# Altium schematic sheet RV1126_DRAM_SHEET.SchDoc
size A4; SheetNumber: 10; SheetTotal: 25
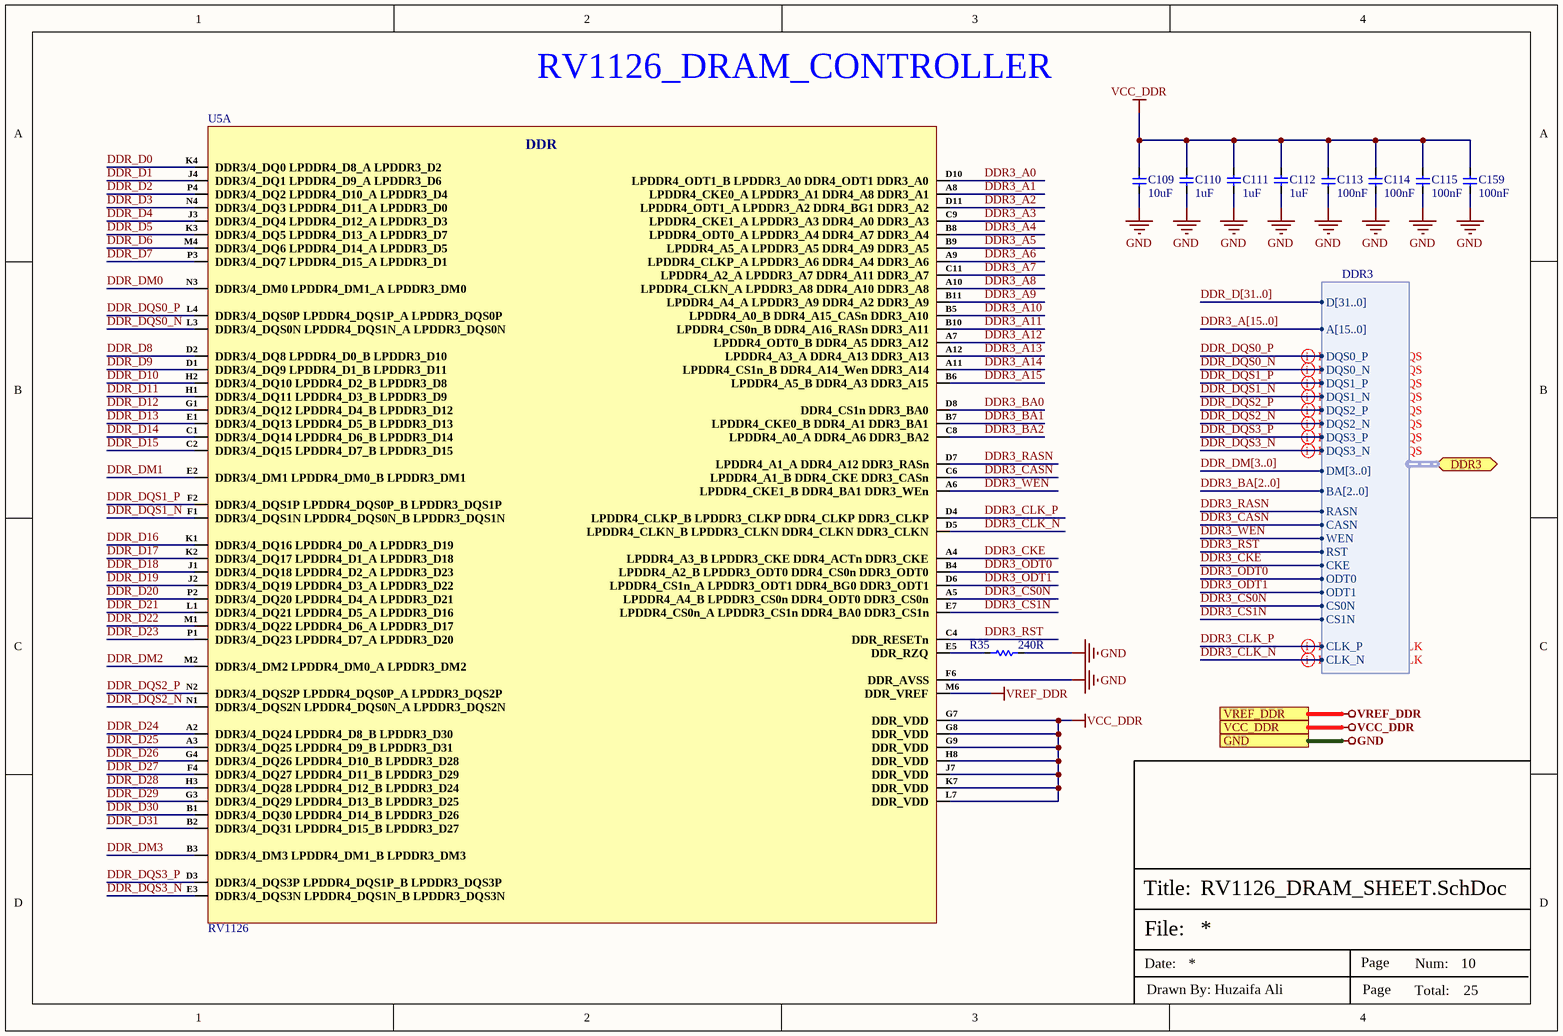
[diagram p0: RV1126_DRAM_SHEET.SchDoc]

## Parts
C109  10uF  [Cap-0603]
C110  1uF  [Cap-0402]
C111  1uF  [Cap-0402]
C112  1uF  [Cap-0402]
C113  100nF  [CAP-0201]
C114  100nF  [CAP-0201]
C115  100nF  [CAP-0201]
C159  100nF  [CAP-0201]
R35  240R  [Res-0201]
U5  RV1126  [FCCSP-409(14x14)]  (part A of 15)

## Ports
DDR3 (bidir, harness DDR3, see DDR3_SDRAM_INTERFACE[4C]), GND (see DDR3_SDRAM_INTERFACE[4D], DIGITAL_MEMS_MIC_INTERFACE[3D], eMMC_INTERFACE[3D], ETHERNET_SWITCH_INTERFACE[5C], IR-CUT_LIGHT SENSOR_SHEET[3D], MIPI TO HDMI_MODULE_INTERFACE[3D], MIPI-CSI_RXX_INTERFACE[4C], PoE PD INTERFACE[3D], PoE_PSE_CONTROLLER[5D], POWER_LDO_SHEET[3D], POWER_PMIC_RK809_CODEC[3D], POWER_PMIC_RK809_DC DC[3D], POWER_PMIC_RK809_LDO[4C], POWER_PMIC_RK809_MANAGEMENT[3D], RV1126_AUDIO_SHEET[3D], RV1126_eMMC_SPI-FLASH_SHEET[3D], RV1126_ETHERNET_SHEET[3D], RV1126_OSC-PLL-PMUIO[3C], RV1126_POWER_SHEET[1D], RV1126_SARADC_SHEET[3C], SPI_FLASH_INTERFACE[3D], SYNCHRONOUS _BUCK_CONTROLLER[3D], USB2.0_DEBUG_UART[3D], WIFI_AP6256_SHEET[4D]), VCC_DDR (see DDR3_SDRAM_INTERFACE[4D], POWER_PMIC_RK809_DC DC[3D]), VREF_DDR (see DDR3_SDRAM_INTERFACE[4D])

## Harnesses
DDR3: D[31..0], A[15..0], DQS0_N, DQS0_P, DQS1_N, DQS1_P, BA[2..0], CASN, RST, CKE, CS0N, CLK_P, CLK_N, DQS2_N, DQS2_P, DQS3_N, DQS3_P, CS1N, ODT0, ODT1, WEN, RASN, DM[3..0]

## Nets
GND: C109.1 C110.2 C111.2 C112.2 C113.1 C114.1 C115.1 C159.1 R35.2 U5.F6(DDR_AVSS) ; port GND
VCC_DDR: C109.2 C110.1 C111.1 C112.1 C113.2 C114.2 C115.2 C159.2 U5.G7(DDR_VDD) U5.G8(DDR_VDD) U5.G9(DDR_VDD) U5.H8(DDR_VDD) U5.J7(DDR_VDD) U5.K7(DDR_VDD) U5.L7(DDR_VDD) ; port VCC_DDR
VREF_DDR: U5.M6(DDR_VREF) ; port VREF_DDR
DDR3_A0: U5.D10(LPDDR4_ODT1_B_LPDDR3_A0_DDR4_ODT1_DDR3_A0)
DDR3_A1: U5.A8(LPDDR4_CKE0_A_LPDDR3_A1_DDR4_A8_DDR3_A1)
DDR3_A2: U5.D11(LPDDR4_ODT1_A_LPDDR3_A2_DDR4_BG1_DDR3_A2)
DDR3_A3: U5.C9(LPDDR4_CKE1_A_LPDDR3_A3_DDR4_A0_DDR3_A3)
DDR3_A4: U5.B8(LPDDR4_ODT0_A_LPDDR3_A4_DDR4_A7_DDR3_A4)
DDR3_A5: U5.B9(LPDDR4_A5_A_LPDDR3_A5_DDR4_A9_DDR3_A5)
DDR3_A6: U5.A9(LPDDR4_CLKP_A_LPDDR3_A6_DDR4_A4_DDR3_A6)
DDR3_A7: U5.C11(LPDDR4_A2_A_LPDDR3_A7_DDR4_A11_DDR3_A7)
DDR3_A8: U5.A10(LPDDR4_CLKN_A_LPDDR3_A8_DDR4_A10_DDR3_A8)
DDR3_A9: U5.B11(LPDDR4_A4_A_LPDDR3_A9_DDR4_A2_DDR3_A9)
DDR3_A10: U5.B5(LPDDR4_A0_B_DDR4_A15_CASn_DDR3_A10)
DDR3_A11: U5.B10(LPDDR4_CS0n_B_DDR4_A16_RASn_DDR3_A11)
DDR3_A12: U5.A7(LPDDR4_ODT0_B_DDR4_A5_DDR3_A12)
DDR3_A13: U5.A12(LPDDR4_A3_A_DDR4_A13_DDR3_A13)
DDR3_A14: U5.A11(LPDDR4_CS1n_B_DDR4_A14_Wen_DDR3_A14)
DDR3_A15: U5.B6(LPDDR4_A5_B_DDR4_A3_DDR3_A15)
DDR3_BA0: U5.D8(DDR4_CS1n_DDR3_BA0)
DDR3_BA1: U5.B7(LPDDR4_CKE0_B_DDR4_A1_DDR3_BA1)
DDR3_BA2: U5.C8(LPDDR4_A0_A_DDR4_A6_DDR3_BA2)
DDR3_CASN: U5.C6(LPDDR4_A1_B_DDR4_CKE_DDR3_CASn) ; port DDR3.CASN
DDR3_CKE: U5.A4(LPDDR4_A3_B_LPDDR3_CKE_DDR4_ACTn_DDR3_CKE) ; port DDR3.CKE
DDR3_CLK_N: U5.D5(LPDDR4_CLKN_B_LPDDR3_CLKN_DDR4_CLKN_DDR3_CLKN) ; port DDR3.CLK_N
DDR3_CLK_P: U5.D4(LPDDR4_CLKP_B_LPDDR3_CLKP_DDR4_CLKP_DDR3_CLKP) ; port DDR3.CLK_P
DDR3_CS0N: U5.A5(LPDDR4_A4_B_LPDDR3_CS0n_DDR4_ODT0_DDR3_CS0n) ; port DDR3.CS0N
DDR3_CS1N: U5.E7(LPDDR4_CS0n_A_LPDDR3_CS1n_DDR4_BA0_DDR3_CS1n) ; port DDR3.CS1N
DDR3_ODT0: U5.B4(LPDDR4_A2_B_LPDDR3_ODT0_DDR4_CS0n_DDR3_ODT0) ; port DDR3.ODT0
DDR3_ODT1: U5.D6(LPDDR4_CS1n_A_LPDDR3_ODT1_DDR4_BG0_DDR3_ODT1) ; port DDR3.ODT1
DDR3_RASN: U5.D7(LPDDR4_A1_A_DDR4_A12_DDR3_RASn) ; port DDR3.RASN
DDR3_RST: U5.C4(DDR_RESETn) ; port DDR3.RST
DDR3_WEN: U5.A6(LPDDR4_CKE1_B_DDR4_BA1_DDR3_WEn) ; port DDR3.WEN
DDR_D0: U5.K4(DDR3/4_DQ0_LPDDR4_D8_A_LPDDR3_D2)
DDR_D1: U5.J4(DDR3/4_DQ1_LPDDR4_D9_A_LPDDR3_D6)
DDR_D2: U5.P4(DDR3/4_DQ2_LPDDR4_D10_A_LPDDR3_D4)
DDR_D3: U5.N4(DDR3/4_DQ3_LPDDR4_D11_A_LPDDR3_D0)
DDR_D4: U5.J3(DDR3/4_DQ4_LPDDR4_D12_A_LPDDR3_D3)
DDR_D5: U5.K3(DDR3/4_DQ5_LPDDR4_D13_A_LPDDR3_D7)
DDR_D6: U5.M4(DDR3/4_DQ6_LPDDR4_D14_A_LPDDR3_D5)
DDR_D7: U5.P3(DDR3/4_DQ7_LPDDR4_D15_A_LPDDR3_D1)
DDR_D8: U5.D2(DDR3/4_DQ8_LPDDR4_D0_B_LPDDR3_D10)
DDR_D9: U5.D1(DDR3/4_DQ9_LPDDR4_D1_B_LPDDR3_D11)
DDR_D10: U5.H2(DDR3/4_DQ10_LPDDR4_D2_B_LPDDR3_D8)
DDR_D11: U5.H1(DDR3/4_DQ11_LPDDR4_D3_B_LPDDR3_D9)
DDR_D12: U5.G1(DDR3/4_DQ12_LPDDR4_D4_B_LPDDR3_D12)
DDR_D13: U5.E1(DDR3/4_DQ13_LPDDR4_D5_B_LPDDR3_D13)
DDR_D14: U5.C1(DDR3/4_DQ14_LPDDR4_D6_B_LPDDR3_D14)
DDR_D15: U5.C2(DDR3/4_DQ15_LPDDR4_D7_B_LPDDR3_D15)
DDR_D16: U5.K1(DDR3/4_DQ16_LPDDR4_D0_A_LPDDR3_D19)
DDR_D17: U5.K2(DDR3/4_DQ17_LPDDR4_D1_A_LPDDR3_D18)
DDR_D18: U5.J1(DDR3/4_DQ18_LPDDR4_D2_A_LPDDR3_D23)
DDR_D19: U5.J2(DDR3/4_DQ19_LPDDR4_D3_A_LPDDR3_D22)
DDR_D20: U5.P2(DDR3/4_DQ20_LPDDR4_D4_A_LPDDR3_D21)
DDR_D21: U5.L1(DDR3/4_DQ21_LPDDR4_D5_A_LPDDR3_D16)
DDR_D22: U5.M1(DDR3/4_DQ22_LPDDR4_D6_A_LPDDR3_D17)
DDR_D23: U5.P1(DDR3/4_DQ23_LPDDR4_D7_A_LPDDR3_D20)
DDR_D24: U5.A2(DDR3/4_DQ24_LPDDR4_D8_B_LPDDR3_D30)
DDR_D25: U5.A3(DDR3/4_DQ25_LPDDR4_D9_B_LPDDR3_D31)
DDR_D26: U5.G4(DDR3/4_DQ26_LPDDR4_D10_B_LPDDR3_D28)
DDR_D27: U5.F4(DDR3/4_DQ27_LPDDR4_D11_B_LPDDR3_D29)
DDR_D28: U5.H3(DDR3/4_DQ28_LPDDR4_D12_B_LPDDR3_D24)
DDR_D29: U5.G3(DDR3/4_DQ29_LPDDR4_D13_B_LPDDR3_D25)
DDR_D30: U5.B1(DDR3/4_DQ30_LPDDR4_D14_B_LPDDR3_D26)
DDR_D31: U5.B2(DDR3/4_DQ31_LPDDR4_D15_B_LPDDR3_D27)
DDR_DM0: U5.N3(DDR3/4_DM0_LPDDR4_DM1_A_LPDDR3_DM0)
DDR_DM1: U5.E2(DDR3/4_DM1_LPDDR4_DM0_B_LPDDR3_DM1)
DDR_DM2: U5.M2(DDR3/4_DM2_LPDDR4_DM0_A_LPDDR3_DM2)
DDR_DM3: U5.B3(DDR3/4_DM3_LPDDR4_DM1_B_LPDDR3_DM3)
DDR_DQS0_N: U5.L3(DDR3/4_DQS0N_LPDDR4_DQS1N_A_LPDDR3_DQS0N) ; port DDR3.DQS0_N
DDR_DQS0_P: U5.L4(DDR3/4_DQS0P_LPDDR4_DQS1P_A_LPDDR3_DQS0P) ; port DDR3.DQS0_P
DDR_DQS1_N: U5.F1(DDR3/4_DQS1N_LPDDR4_DQS0N_B_LPDDR3_DQS1N) ; port DDR3.DQS1_N
DDR_DQS1_P: U5.F2(DDR3/4_DQS1P_LPDDR4_DQS0P_B_LPDDR3_DQS1P) ; port DDR3.DQS1_P
DDR_DQS2_N: U5.N1(DDR3/4_DQS2N_LPDDR4_DQS0N_A_LPDDR3_DQS2N) ; port DDR3.DQS2_N
DDR_DQS2_P: U5.N2(DDR3/4_DQS2P_LPDDR4_DQS0P_A_LPDDR3_DQS2P) ; port DDR3.DQS2_P
DDR_DQS3_N: U5.E3(DDR3/4_DQS3N_LPDDR4_DQS1N_B_LPDDR3_DQS3N) ; port DDR3.DQS3_N
DDR_DQS3_P: U5.D3(DDR3/4_DQS3P_LPDDR4_DQS1P_B_LPDDR3_DQS3P) ; port DDR3.DQS3_P
NetR35_1: R35.1 U5.E5(DDR_RZQ)

## Buses and harness runs
bus DDR3_A[15..0]
bus DDR3_BA[2..0]
bus DDR_D[31..0]
bus DDR_DM[3..0]

## Layout directives
differential pair; differential pair class 100OHM_DDR_DQS: DDR_DQS0_N, DDR_DQS0_P, DDR_DQS1_N, DDR_DQS1_P, DDR_DQS2_N, DDR_DQS2_P, DDR_DQS3_N, DDR_DQS3_P
differential pair; differential pair class 100OHM_DDR_CLK: DDR3_CLK_N, DDR3_CLK_P

## Notes on the sheet
- RV1126_DRAM_CONTROLLER
- File:
- Title:
- Date:
- Page
- Num:
- Total:
- Drawn By: Huzaifa Ali
- (in symbol RV1126, part A) DDR

## Library data of the parts
C109 = CC0603KRX5R6BB106: CAP CER 10UF 10V X5R 0603; Manufacturer: Yageo; Tolerance: 10%; Item Type: Capacitor; Supplier 1: Digi-Key; Manufacturer Part Number: CC0603KRX5R6BB106; RoHS: Yes; Category: Ceramic Capacitors; Stock 1: 187515; Pricing 1: 1=0.24000, 10=0.16300, 50=0.09780, 100=0.08260, 500=0.05654, 1000=0.05001 (USD); Mount: Surface Mount; Case/Package: 0603; Case Code (Metric): 1608; Case Code (Imperial): 0603; Weight: 7.1E-05oz; Min Operating Temperature: -55°C; Max Operating Temperature: 85°C; Capacitance: 10uF; Packaging: Tape and Reel; Dielectric: X5R; Voltage Rating: 10V; Termination: SMD/SMT; Resistor Type: Ceramic; Voltage Rating (DC): 10V; Package Quantity: 4000; Length: 0.063inch; Width: 0.031inch; Thickness: 0.035inch; Depth: 0.8mm; Lead Free: Lead Free; Halogen Free: Halogen Free; RoHS Compliant: Yes; ComponentLink1URL: http://www.mouser.com/ds/2/447/Yageo_UPY-GP_NP0_16V-to-50V_9-358835.pdf?src-supplier=Mouser; ComponentLink1Description: http://www.mouser.com/ds/2/447/Yageo_UPY-GP_NP0_16V-to-50V_9-358835.pdf?src-supplier=Mouser; ComponentLink2URL: http://www.yageo.com/documents/recent/UPY-GPHC_X5R_4V-to-50V_25.pdf?src-supplier=Digi-Key; ComponentLink2Description: http://www.yageo.com/documents/recent/UPY-GPHC_X5R_4V-to-50V_25.pdf?src-supplier=Digi-Key; Supplier Part Number 1: 311-1782-1-ND; LCSC Part Number: C326057
C110-C112 = CC0402KRX5R6BB105: CAP CER 1UF 10V X5R 0402; Manufacturer: Yageo; Tolerance: 10%; Dissipation Factor: 15%; Item Type: Capacitor; Supplier 1: Mouser; Manufacturer Part Number: CC0402KRX5R6BB105; RoHS: Yes; Category: Ceramic Capacitors; Stock 1: 6711367; Pricing 1: 1=0.11000, 10=0.05500, 50=0.05500, 100=0.03300, 500=0.02700, 1000=0.02200, 2500=0.02100, 10000=0.01800 (USD); Mount: Surface Mount; Case/Package: 0402; Number of Pins: 2; Case Code (Metric): 1005; Case Code (Imperial): 0402; Min Operating Temperature: -55°C; Max Operating Temperature: 85°C; Capacitance: 1uF; Dielectric: X5R; Package Quantity: 1; Voltage Rating: 10V; Packaging: Tape and Reel; Voltage Rating (DC): 10V; Termination: SMD/SMT; Resistor Type: Ceramic; Series: CC; Construction: Flat; Length: 1mm; Width: 0.02inch; Height: 0.5mm; Thickness: 0.022inch; Depth: 0.5mm; Radiation Hardening: No; REACH SVHC: No SVHC; Lead Free: Lead Free; Halogen Free: Halogen Free; RoHS Compliant: Yes; ComponentLink1URL: https://datasheet.ciiva.com/176/upy-gphc-x5r-4v-to-50v-12-176704.pdf?src-supplier=Digi-Key; ComponentLink1Description: https://datasheet.ciiva.com/176/upy-gphc-x5r-4v-to-50v-12-176704.pdf?src-supplier=Digi-Key; ComponentLink2URL: https://datasheet.ciiva.com/176/mlccorderingcode-176705.pdf?src-supplier=Digi-Key; ComponentLink2Description: https://datasheet.ciiva.com/176/mlccorderingcode-176705.pdf?src-supplier=Digi-Key; ComponentLink3URL: https://datasheet.ciiva.com/176/mlccorderingcode-176706.pdf?src-supplier=Digi-Key; ComponentLink3Description: https://datasheet.ciiva.com/176/mlccorderingcode-176706.pdf?src-supplier=Digi-Key; Supplier Part Number 1: 603-CC402KRX5R6BB105; LCSC Part Number: C106254
C113-C115 C159 = CC0201KRX5R6BB104: CAP CER 0.1UF 10V X5R 0201; Manufacturer: Yageo; Tolerance: 10%; Supplier 1: Mouser; Manufacturer Part Number: CC0201KRX5R6BB104; RoHS: Yes; Category: Ceramic Capacitors; Stock 1: 824403; Pricing 1: 1=0.10000, 10=0.02400, 50=0.02400, 100=0.01900, 1000=0.01100, 10000=0.00900 (USD); Mount: Surface Mount; Case/Package: 0201; Case Code (Imperial): 0201; Case Code (Metric): 0603; Min Operating Temperature: -55°C; Max Operating Temperature: 85°C; Capacitance: 100nF; Dielectric: X5R; Packaging: Tape and Reel; Voltage Rating: 10V; Termination: SMD/SMT; Voltage Rating (DC): 10V; Series: CC; Length: 0.6mm; Width: 0.012inch; Height: 0.3mm; Depth: 0.3mm; Thickness: 0.013inch; Radiation Hardening: No; RoHS Compliant: Yes; Lead Free: Lead Free; Halogen Free: Halogen Free; ComponentLink1URL: https://datasheet.ciiva.com/11587/upy-gphc-x5r-4v-to-50v-12-11587190.pdf?src-supplier=Avnet; ComponentLink1Description: https://datasheet.ciiva.com/11587/upy-gphc-x5r-4v-to-50v-12-11587190.pdf?src-supplier=Avnet; Supplier Part Number 1: 603-CC201KRX5R6BB104; LCSC Part Number: C190183; Weight: 6E-06oz; Resistor Type: Ceramic; Construction: Flat
R35 = RC0201FR-07240RL: RES 240 OHM 1% 1/20W 0201; Manufacturer: Yageo; Power Rating: 50mW; Temperature Coefficient: 200ppm/°C; Item Type: Resistor; Supplier 1: Avnet; Manufacturer Part Number: RC0201FR-07240RL; RoHS: Yes; Category: Chip SMD Resistors; Stock 1: 90000; Pricing 1: 10000=0.00128 (USD); Mount: Surface Mount; Case/Package: 0201; Case Code (Metric): 0603; Case Code (Imperial): 0201; Min Operating Temperature: -55°C; Max Operating Temperature: 125°C; Resistance: 240R; Tolerance: 1%; Packaging: Tape and Reel; Resistor Type: Thick Film; Number of Terminations: 2; Max Power Dissipation: 50mW; Features: Moisture Resistant; Length: 0.024inch; Width: 0.012inch; Height: 0.01inch; Depth: 0.3mm; Military Standard: Not; Lead Free: Lead Free; RoHS Compliant: Yes; ComponentLink1URL: http://www.yageo.com/documents/recent/PYu-RC0201_51_RoHS_L_(8).pdf?src-supplier=Future+Electronics; ComponentLink1Description: http://www.yageo.com/documents/recent/PYu-RC0201_51_RoHS_L_(8).pdf?src-supplier=Future+Electronics; ComponentLink2URL: http://www.yageo.com/documents/recent/PYu-RC_Group_51_RoHS_L_10.pdf?src-supplier=Digi-Key; ComponentLink2Description: http://www.yageo.com/documents/recent/PYu-RC_Group_51_RoHS_L_10.pdf?src-supplier=Digi-Key; ComponentLink3URL: https://www.yageo.com/upload/media/product/productsearch/datasheet/rchip/PYu-RC_Group_51_RoHS_L_11.pdf?src-supplier=Digi-Key; ComponentLink3Description: https://www.yageo.com/upload/media/product/productsearch/datasheet/rchip/PYu-RC_Group_51_RoHS_L_11.pdf?src-supplier=Digi-Key; ComponentLink4URL: http://www.yageo.com/documents/recent/PYu-RC_Group_51_RoHS_L_9.pdf?src-supplier=Digi-Key; ComponentLink4Description: http://www.yageo.com/documents/recent/PYu-RC_Group_51_RoHS_L_9.pdf?src-supplier=Digi-Key; Supplier Part Number 1: RC0201FR-07240RL; LCSC Part Number: C155745
U5 = RV1126: FCCSP-409(14x14) Microcontroller Units (MCUs/MPUs/SOCs) ROHS; Manufacturer: Rockchip; Manufacturer Part Number: RV1126; Package: FCCSP-409(14x14); LCSC Part Number: C2859017; Item Type: Microcontroller; ComponentLink1Description: LCSC; ComponentLink1URL: https://www.lcsc.com/product-detail/Microcontroller-Units-MCUs-MPUs-SOCs_Rockchip-RV1126_C2859017.html